# Altium schematic sheet USB3.0_INTERFACE.SchDoc
size A4; SheetNumber: 7; SheetTotal: 20
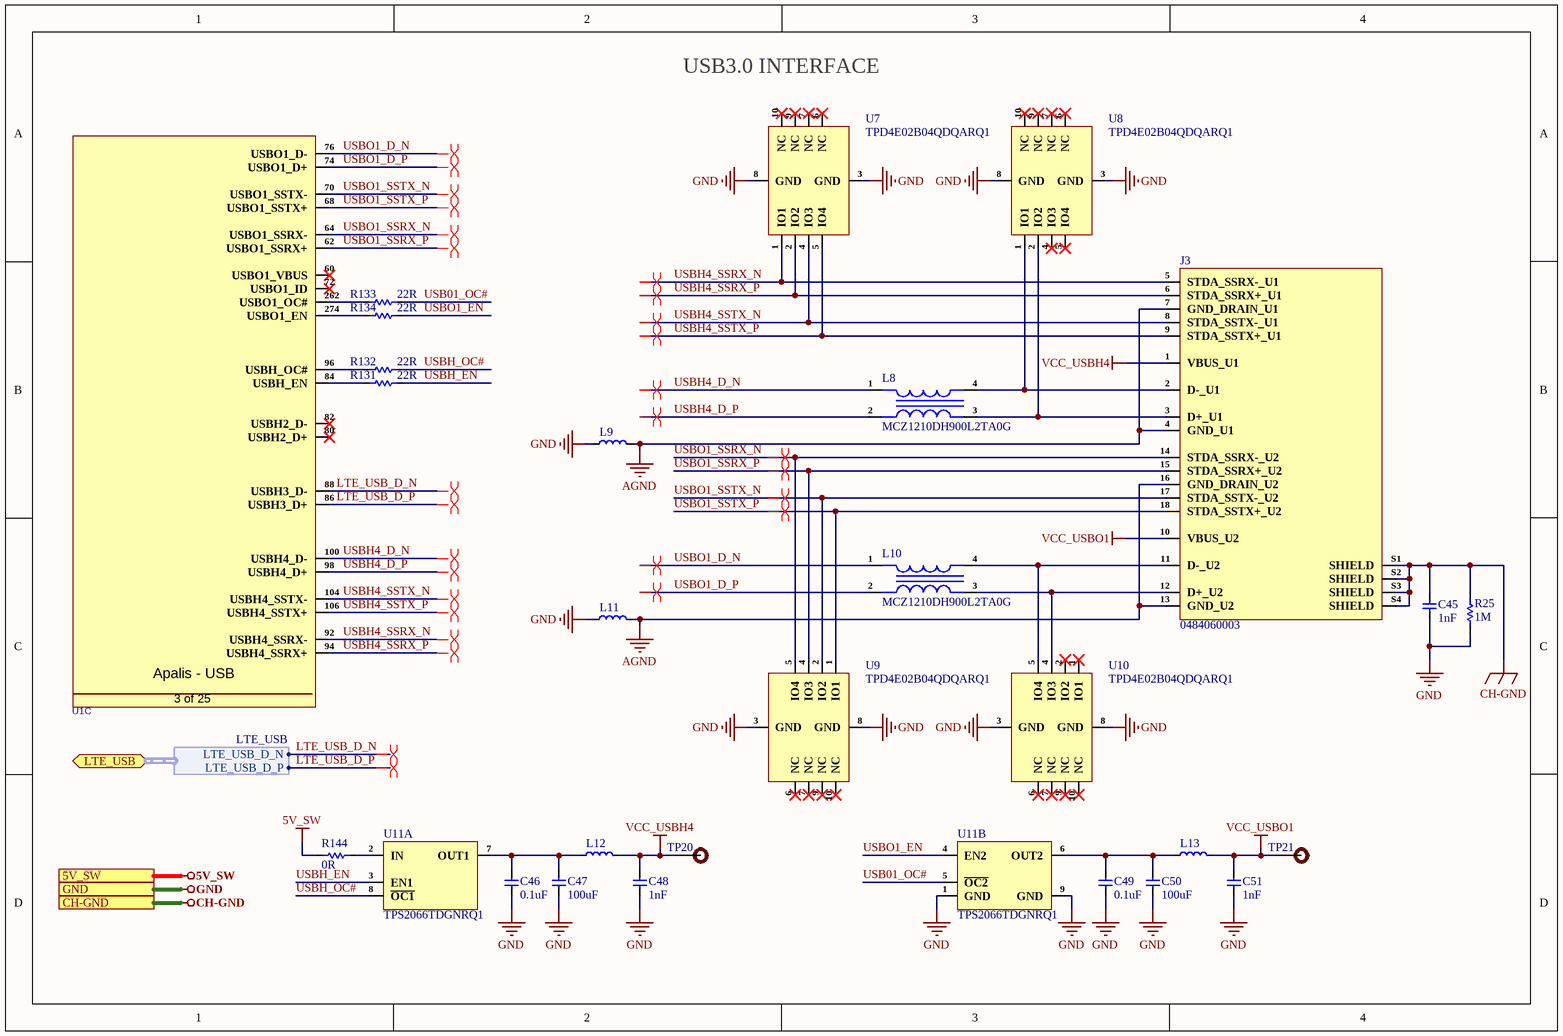
[diagram p0: USB3.0_INTERFACE.SchDoc]

## Parts
C45  1nF  [Cap-1206]
C46  0.1uF  [Cap-0402]
C47  100uF  [Cap-1210]
C48  1nF  [Cap-0402]
C49  0.1uF  [Cap-0402]
C50  100uF  [Cap-1210]
C51  1nF  [Cap-0402]
J3  0484060003  [0484060003]
L8  MCZ1210DH900L2TA0G  [MCZ1210DH900L2TA0G]
L9  BLM18EG221TN1D  [IND-0603 (1608 Metric)]  (value not drawn)
L10  MCZ1210DH900L2TA0G  [MCZ1210DH900L2TA0G]
L11  BLM18EG221TN1D  [IND-0603 (1608 Metric)]  (value not drawn)
L12  BLM18EG221TN1D  [IND-0603 (1608 Metric)]  (value not drawn)
L13  BLM18EG221TN1D  [IND-0603 (1608 Metric)]  (value not drawn)
R25  1M  [Res-0402]
R131  22R  [Res-0402]
R132  22R  [Res-0402]
R133  22R  [Res-0402]
R134  22R  [Res-0402]
R144  0R  [Res-1206]
TP20  DNP  [Test-point]  (value not drawn)
TP21  DNP  [Test-point]  (value not drawn)
U1  MM70-314B1-2-R300  [MM70-314B1-2-R300]  (value not drawn)  (part C of 25)
U7  TPD4E02B04QDQARQ1  [10-USON (2.5x1)]
U8  TPD4E02B04QDQARQ1  [10-USON (2.5x1)]
U9  TPD4E02B04QDQARQ1  [10-USON (2.5x1)]
U10  TPD4E02B04QDQARQ1  [10-USON (2.5x1)]
U11  TPS2066TDGNRQ1  [8-HVSSOP]  (parts A,B of 2)

## Ports
5V_SW (see Top_Sheet[1C], APALIS_POWER_SUPPLY[1D], CODEC_INTERFACE[1D], FUTURE_USE_CONNECTOR[1D], HDMI_INTERFACE[1D], LTE_MODULE[1D]), CH-GND (see Top_Sheet[1C], ETHERNET_INTERFACE[1D], HDMI_INTERFACE[1D], LTE_MODULE[1D], MECHANICAL_FOR_PCB[1D]), GND (see Top_Sheet[1C], 03-CAN2_SPI_CAN_CONTROLLER[1D], APALIS_POWER_SUPPLY[1D], CAN2_SPI_CAN_CONTROLLER[1D], CODEC_INTERFACE[1D], CONNECTORS[1D], DC_DC_CONVERTER[1D], DIGITAL_I-O_O-P[1D], ETHERNET_INTERFACE[1D], FUTURE_USE_CONNECTOR[1D], GPIO_NC_INTERFACE[4B], HDMI_INTERFACE[1D], I2C_INTERFACE[1B], INPUT_SUPPLY_PROTECTION[1D], LTE_MODULE[1D], MECHANICAL_FOR_PCB[1D], MICRO_SD_CARD_INTERFACE[1D], Reset_and_SDIO[1D], UART_INTERFACE[1D]), LTE_USB (bidir, harness LTE_USB, see Top_Sheet[1C], LTE_MODULE[2D])

## Harnesses
LTE_USB: LTE_USB_D_N, LTE_USB_D_P

## Nets
5V_SW: R144.1 ; port 5V_SW
AGND: J3.4(GND_U1) J3.7(GND_DRAIN_U1) J3.13(GND_U2) J3.16(GND_DRAIN_U2) L9.2 L11.2
CH-GND: C45.2 J3.S1(SHIELD) J3.S2(SHIELD) J3.S3(SHIELD) J3.S4(SHIELD) R25.2 ; port CH-GND
GND: C45.1 C46.1 C47.1 C48.1 C49.1 C50.1 C51.1 L9.1 L11.1 R25.1 U7.3(GND) U7.8(GND) U8.3(GND) U8.8(GND) U9.3(GND) U9.8(GND) U10.3(GND) U10.8(GND) U11.1(GND) U11.9(GND) ; port GND
VCC_USBH4: C48.2 J3.1(VBUS_U1) L12.2 TP20.1
VCC_USBO1: C51.2 J3.10(VBUS_U2) L13.2 TP21.1
LTE_USB_D_N: U1.88(USBH3_D-) ; port LTE_USB.LTE_USB_D_N
LTE_USB_D_P: U1.86(USBH3_D+) ; port LTE_USB.LTE_USB_D_P
USB01_OC#: R133.2 U11.5(~{OC2})
USBH4_D_N: L8.1 U1.100(USBH4_D-)
USBH4_D_P: L8.2 U1.98(USBH4_D+)
USBH4_SSRX_N: J3.5(STDA_SSRX-_U1) U1.92(USBH4_SSRX-) U7.1(IO1)
USBH4_SSRX_P: J3.6(STDA_SSRX+_U1) U1.94(USBH4_SSRX+) U7.2(IO2)
USBH4_SSTX_N: J3.8(STDA_SSTX-_U1) U1.104(USBH4_SSTX-) U7.4(IO3)
USBH4_SSTX_P: J3.9(STDA_SSTX+_U1) U1.106(USBH4_SSTX+) U7.5(IO4)
USBH_EN: R131.2 U11.3(EN1)
USBH_OC#: R132.2 U11.8(~{OC1})
USBO1_D_N: L10.1 U1.76(USBO1_D-)
USBO1_D_P: L10.2 U1.74(USBO1_D+)
USBO1_EN: R134.2 U11.4(EN2)
USBO1_SSRX_N: J3.14(STDA_SSRX-_U2) U1.64(USBO1_SSRX-) U9.5(IO4)
USBO1_SSRX_P: J3.15(STDA_SSRX+_U2) U1.62(USBO1_SSRX+) U9.4(IO3)
USBO1_SSTX_N: J3.17(STDA_SSTX-_U2) U1.70(USBO1_SSTX-) U9.2(IO2)
USBO1_SSTX_P: J3.18(STDA_SSTX+_U2) U1.68(USBO1_SSTX+) U9.1(IO1)
NetC46_2: C46.2 C47.2 L12.1 U11.7(OUT1)
NetC49_2: C49.2 C50.2 L13.1 U11.6(OUT2)
NetJ3_2: J3.2(D-_U1) L8.4 U8.1(IO1)
NetJ3_3: J3.3(D+_U1) L8.3 U8.2(IO2)
NetJ3_11: J3.11(D-_U2) L10.4 U10.5(IO4)
NetJ3_12: J3.12(D+_U2) L10.3 U10.4(IO3)
NetR131_1: R131.1 U1.84(USBH_EN)
NetR132_1: R132.1 U1.96(USBH_OC#)
NetR133_1: R133.1 U1.262(USBO1_OC#)
NetR134_1: R134.1 U1.274(USBO1_EN)
NetR144_2: R144.2 U11.2(IN)

Not connected (* = marked no-connect by the designer): U1 60(USBO1_VBUS)* 72(USBO1_ID)* 80(USBH2_D+)* 82(USBH2_D-)*; U7 6(NC)* 7(NC)* 9(NC)* 10(NC)*; U8 4(IO3)* 5(IO4)* 6(NC)* 7(NC)* 9(NC)* 10(NC)*; U9 6(NC)* 7(NC)* 9(NC)* 10(NC)*; U10 1(IO1)* 2(IO2)* 6(NC)* 7(NC)* 9(NC)* 10(NC)*

## Layout directives
differential pair; differential pair class LTE USB; rule Matched Net Lengths [Tolerance = 0.508mm]; rule Impedance Constraint [Min = 115.0    Max = 125.0    ]: LTE_USB_D_N, LTE_USB_D_P, USBH4_D_N, USBH4_D_P, USBH4_SSRX_N, USBH4_SSRX_P, USBH4_SSTX_N, USBH4_SSTX_P, USBO1_D_N, USBO1_D_P, USBO1_SSRX_N, USBO1_SSRX_P, USBO1_SSTX_N, USBO1_SSTX_P

## Notes on the sheet
- (near U7) USB3.0 INTERFACE
- (in symbol MM70-314B1-2-R300, part C) Apalis - USB; 3 of 25

## Library data of the parts
C45 = C1206C102KGRACAUTO: CAP CER 1000PF 2KV X7R 1206; Manufacturer: KEMET; Dielectric Material: Ceramic; Tolerance: 10%; Supplier: Mouser; Supplier Part Number: 80-C1206C102KGRAUTO; Manufacturer Part Number: C1206C102KGRACAUTO; RoHS: No; Category: Ceramic Capacitors; Stock: 90441; Pricing: 1=0.26, 10=0.119, 50=0.119, 100=0.072, 1000=0.063, 10000=0.052 (USD); Mounting Technology: Surface Mount; Case/Package: 1206; Case Code (Metric): 3216; Case Code (Imperial): 1206; Contact Plating: Tin,Matte; Min Operating Temperature: -55°C; Max Operating Temperature: 125°C; Voltage Rating: 2kV; Packaging: Cut Tape; Value: 1nF; Dielectric: X7R; Termination: SMD/SMT; Voltage Rating (DC): 2kV; Series: SMD Auto X7R HV; Construction: Flat; Length: 3.2mm; Ratings: AEC-Q200; Reach SVHC Compliant: No; RoHS Compliant: No; ComponentLink1URL: http://www.farnell.com/datasheets/2741171.pdf?src-supplier=Farnell; ComponentLink1Description: http://www.farnell.com/datasheets/2741171.pdf?src-supplier=Farnell; ComponentLink2URL: http://www.mouser.com/ds/2/212/KEM_C1010_X7R_HV_SMD-1102742.pdf?src-supplier=Mouser; ComponentLink2Description: http://www.mouser.com/ds/2/212/KEM_C1010_X7R_HV_SMD-1102742.pdf?src-supplier=Mouser; ComponentLink3URL: http://capacitoredge.kemet.com/capedge2/DataSheet/Datasheet-C1206C102KGRACAUTO.pdf?pn=C1206C102KGRACAUTO&src-supplier=Avnet; ComponentLink3Description: http://capacitoredge.kemet.com/capedge2/DataSheet/Datasheet-C1206C102KGRACAUTO.pdf?pn=C1206C102KGRACAUTO&src-supplier=Avnet; ComponentLink4URL: http://www.farnell.com/datasheets/2741171.pdf?src-supplier=Newark; ComponentLink4Description: http://www.farnell.com/datasheets/2741171.pdf?src-supplier=Newark; ComponentLink5URL: https://datasheet.octopart.com/C1206C102KGRACAUTO-Kemet-datasheet-41767101.pdf?src-supplier=Newark; ComponentLink5Description: https://datasheet.octopart.com/C1206C102KGRACAUTO-Kemet-datasheet-41767101.pdf?src-supplier=Newark; ComponentLink6URL: https://api.kemet.com/component-edge/download/datasheet/C1206C102KGRACAUTO.pdf?src-supplier=Digi-Key; ComponentLink6Description: https://api.kemet.com/component-edge/download/datasheet/C1206C102KGRACAUTO.pdf?src-supplier=Digi-Key; ComponentLink7URL: https://datasheet.octopart.com/C1206C102KGRACAUTO-KEMET-datasheet-149525142.pdf?src-supplier=Farnell; ComponentLink7Description: https://datasheet.octopart.com/C1206C102KGRACAUTO-KEMET-datasheet-149525142.pdf?src-supplier=Farnell; ComponentLink8URL: http://www.farnell.com/datasheets/2741171.pdf?src-supplier=Element14; ComponentLink8Description: http://www.farnell.com/datasheets/2741171.pdf?src-supplier=Element14; ComponentLink9URL: https://datasheet.octopart.com/C1206C102KGRACAUTO-Kemet-datasheet-66532414.pdf?src-supplier=Element14; ComponentLink9Description: https://datasheet.octopart.com/C1206C102KGRACAUTO-Kemet-datasheet-66532414.pdf?src-supplier=Element14; ComponentLink10URL: https://datasheet.octopart.com/C1206C102KGRACAUTO-KEMET-datasheet-140424778.pdf?src-supplier=TME; ComponentLink10Description: https://datasheet.octopart.com/C1206C102KGRACAUTO-KEMET-datasheet-140424778.pdf?src-supplier=TME; ComponentLink11URL: https://datasheet.octopart.com/C1206C102KGRACAUTO-KEMET-datasheet-147336163.pdf?src-supplier=LKR; ComponentLink11Description: https://datasheet.octopart.com/C1206C102KGRACAUTO-KEMET-datasheet-147336163.pdf?src-supplier=LKR
C46 C49 = C0402C104K4REC7867: Cap Cer 0402 0.1UF 16V X7R 10%; Manufacturer: KEMET; Item Type: Capacitor; Supplier: Digi-Key; Supplier Part Number: 399-C0402C104K4REC7867CT-ND; Manufacturer Part Number: C0402C104K4REC7867; RoHS: No; Category: Ceramic Capacitors; Stock: 10918; Pricing: 1=0.1, 10=0.072, 50=0.0408, 100=0.0338, 500=0.02372, 1000=0.01963, 2500=0.01827, 5000=0.01672 (USD)
C47 C50 = C3225X7T1A107M250AC: CAP CER 100UF 10V X7T 1210; Manufacturer: TDK; Supplier: Digi-Key; Supplier Part Number: 445-C3225X7T1A107M250ACCT-ND; Manufacturer Part Number: C3225X7T1A107M250AC; RoHS: Yes; Category: Ceramic Capacitors; Stock: 654; Pricing: 1=1.75, 10=1.385, 50=1.2004, 100=1.0388, 500=0.78484 (USD)
C48 C51 = C0402S102K5RAC7867: CAP CER 1000PF 50V X7R 0402; Manufacturer: KEMET; Item Type: Capacitor; Supplier: Mouser; Supplier Part Number: 80-C0402S102K5R7867; Manufacturer Part Number: C0402S102K5RAC7867; RoHS: Yes; Stock: 17394; Pricing: 1=0.43, 10=0.208, 50=0.208, 100=0.156, 1000=0.113, 10000=0.092 (USD); RoHS Compliant: Yes; ComponentLink1URL: https://api.kemet.com/component-edge/download/datasheet/C0402S102K5RAC7867.pdf?src-supplier=Digi-Key; ComponentLink1Description: https://api.kemet.com/component-edge/download/datasheet/C0402S102K5RAC7867.pdf?src-supplier=Digi-Key
J3 = 0484060003: CONN RCPT USB3.0 TYPEA STACK R/A; Manufacturer: Molex; Supplier: Mouser; Supplier Part Number: 538-48406-0003; Manufacturer Part Number: 0484060003; RoHS: Yes; Stock: 6983; Pricing: 1=2.63, 10=2.32, 50=2.32, 100=1.84, 1000=1.79, 10000=1.36 (USD); ComponentLink1URL: https://datasheet.octopart.com/48406-0003-Molex-datasheet-101583044.pdf?src-supplier=Farnell; ComponentLink1Description: https://datasheet.octopart.com/48406-0003-Molex-datasheet-101583044.pdf?src-supplier=Farnell; ComponentLink2URL: https://www.molex.com/pdm_docs/sd/484060003_sd.pdf?src-supplier=Digi-Key; ComponentLink2Description: https://www.molex.com/pdm_docs/sd/484060003_sd.pdf?src-supplier=Digi-Key; ComponentLink3URL: https://datasheet.octopart.com/48406-0003-Molex-datasheet-33003502.pdf?src-supplier=Newark; ComponentLink3Description: https://datasheet.octopart.com/48406-0003-Molex-datasheet-33003502.pdf?src-supplier=Newark; ComponentLink4URL: https://datasheet.octopart.com/48406-0003-Molex-datasheet-21137617.pdf?src-supplier=Sager+Electronics; ComponentLink4Description: https://datasheet.octopart.com/48406-0003-Molex-datasheet-21137617.pdf?src-supplier=Sager+Electronics; ComponentLink5URL: https://datasheet.octopart.com/484060003-Molex-datasheet-168216735.pdf?src-supplier=TME; ComponentLink5Description: https://datasheet.octopart.com/484060003-Molex-datasheet-168216735.pdf?src-supplier=TME; ComponentLink6URL: https://datasheet.octopart.com/48406-0003-Molex-datasheet-154752298.pdf?src-supplier=Master+Electronics; ComponentLink6Description: https://datasheet.octopart.com/48406-0003-Molex-datasheet-154752298.pdf?src-supplier=Master+Electronics
L8 L10 = MCZ1210DH900L2TA0G: CMC 100MA 2LN 90 OHM SMD; Manufacturer: TDK; Supplier: Mouser; Supplier Part Number: 810-MCZ1210DH900L2TG; Manufacturer Part Number: MCZ1210DH900L2TA0G; RoHS: Yes; Category: Common Mode Chokes; Stock: 11260; Pricing: 1=0.58, 10=0.372, 50=0.372, 100=0.297, 1000=0.231, 10000=0.231 (USD); ComponentLink1URL: https://media.digikey.com/pdf/Data%20Sheets/TDK%20PDFs/MCZ_Series_Br.pdf?src-supplier=Digi-Key; ComponentLink1Description: https://media.digikey.com/pdf/Data%20Sheets/TDK%20PDFs/MCZ_Series_Br.pdf?src-supplier=Digi-Key; ComponentLink2URL: https://product.tdk.com/info/en/catalog/datasheets/cmf_commercial_signal_mcz1210dh_en.pdf?src-supplier=Digi-Key; ComponentLink2Description: https://product.tdk.com/info/en/catalog/datasheets/cmf_commercial_signal_mcz1210dh_en.pdf?src-supplier=Digi-Key
L9 L11-L13 = BLM18EG221TN1D: FERRITE BEAD 220 OHM 0603 1LN; Manufacturer: Murata; Supplier: Avnet; Supplier Part Number: BLM18EG221TN1D; Manufacturer Part Number: BLM18EG221TN1D; RoHS: Yes; Category: Ferrite Beads and Chips; Stock: 4000; Pricing: 4000=0.07735, 8000=0.07553, 16000=0.07371, 24000=0.07189, 32000=0.07007 (USD); ComponentLink1URL: https://datasheet.ciiva.com/11795/0900766b811b5866-11795384.pdf?src-supplier=Rs; ComponentLink1Description: https://datasheet.ciiva.com/11795/0900766b811b5866-11795384.pdf?src-supplier=Rs; ComponentLink2URL: https://datasheet.ciiva.com/41449/001172266-da-01-en-drossel-0603-220r-1-6x0-8mm-4000st-41449580.pdf?src-supplier=Conrad; ComponentLink2Description: https://datasheet.ciiva.com/41449/001172266-da-01-en-drossel-0603-220r-1-6x0-8mm-4000st-41449580.pdf?src-supplier=Conrad; ComponentLink3URL: https://datasheet.ciiva.com/1467/5169-1467159.pdf?src-supplier=Element14; ComponentLink3Description: https://datasheet.ciiva.com/1467/5169-1467159.pdf?src-supplier=Element14; ComponentLink4URL: https://datasheet.ciiva.com/1467/5169-1467160.pdf?src-supplier=Element14; ComponentLink4Description: https://datasheet.ciiva.com/1467/5169-1467160.pdf?src-supplier=Element14; ComponentLink5URL: https://datasheet.ciiva.com/8510/l0110s0101blm18e-8510167.pdf?src-supplier=Avnet; ComponentLink5Description: https://datasheet.ciiva.com/8510/l0110s0101blm18e-8510167.pdf?src-supplier=Avnet; ComponentLink6URL: https://datasheet.ciiva.com/16419/l0110s0101blm18e-16419150.pdf?src-supplier=Future+Electronics; ComponentLink6Description: https://datasheet.ciiva.com/16419/l0110s0101blm18e-16419150.pdf?src-supplier=Future+Electronics; ComponentLink7URL: https://datasheet.ciiva.com/6211/l0110s0101blm18e-6211853.pdf?src-supplier=Digi-Key; ComponentLink7Description: https://datasheet.ciiva.com/6211/l0110s0101blm18e-6211853.pdf?src-supplier=Digi-Key
R25 = CRGCQ0402J1M0: RES 1M OHM 5% 1/16W 0402; Manufacturer: TE Connectivity; Value: 1MR; Max Power Dissipation: 63mW; Temperature Coefficient: 100ppm/°C; Power Rating: 62.5mW; Voltage Rating: 50V; Supplier: Arrow Electronics; Supplier Part Number: CRGCQ0402J1M0; Manufacturer Part Number: CRGCQ0402J1M0; RoHS: Yes; Category: Chip SMD Resistors; Stock: 50000; Pricing: 20000=0.0015 (USD); Case/Package: 0402; Case Code (Imperial): 0402; Case Code (Metric): 1005; Min Operating Temperature: -55°C; Max Operating Temperature: 155°C; Features: Moisture Resistant,Automotive AEC-Q200; Packaging: Cut Tape; Tolerance: 5%; Number of Terminations: 2; Series: CRGCQ; Voltage Rating (DC): 50V; Height: 400um; Ratings: AEC-Q200; RoHS Compliant: Yes; ComponentLink1URL: http://datasheet.octopart.com/CRGCQ0402J1M0-TE-Connectivity-datasheet-114679081.pdf?src-supplier=Mouser; ComponentLink1Description: http://datasheet.octopart.com/CRGCQ0402J1M0-TE-Connectivity-datasheet-114679081.pdf?src-supplier=Mouser; ComponentLink2URL: http://datasheet.octopart.com/CRGCQ0402J1M0-TE-Connectivity-datasheet-114679081.pdf?src-supplier=Arrow+Electronics; ComponentLink2Description: http://datasheet.octopart.com/CRGCQ0402J1M0-TE-Connectivity-datasheet-114679081.pdf?src-supplier=Arrow+Electronics; ComponentLink3URL: http://datasheet.octopart.com/CRGCQ0402J1M0-TE-Connectivity-datasheet-114679081.pdf?src-supplier=Onlinecomponents.com; ComponentLink3Description: http://datasheet.octopart.com/CRGCQ0402J1M0-TE-Connectivity-datasheet-114679081.pdf?src-supplier=Onlinecomponents.com; ComponentLink4URL: http://datasheet.octopart.com/CRGCQ0402J1M0-TE-Connectivity-datasheet-114679081.pdf?src-supplier=Digi-Key; ComponentLink4Description: http://datasheet.octopart.com/CRGCQ0402J1M0-TE-Connectivity-datasheet-114679081.pdf?src-supplier=Digi-Key; ComponentLink5URL: http://datasheet.octopart.com/CRGCQ0402J1M0-TE-Connectivity-datasheet-114679081.pdf?src-supplier=Verical; ComponentLink5Description: http://datasheet.octopart.com/CRGCQ0402J1M0-TE-Connectivity-datasheet-114679081.pdf?src-supplier=Verical; ComponentLink6URL: https://www.te.com/commerce/DocumentDelivery/DDEController?Action=srchrtrv&DocNm=1773204-3&DocType=DS&DocLang=English&src-supplier=Digi-Key; ComponentLink6Description: https://www.te.com/commerce/DocumentDelivery/DDEController?Action=srchrtrv&DocNm=1773204-3&DocType=DS&DocLang=English&src-supplier=Digi-Key; ComponentLink7URL: http://datasheet.octopart.com/CRGCQ0402J1M0-TE-Connectivity-datasheet-114679081.pdf?src-supplier=Newark; ComponentLink7Description: http://datasheet.octopart.com/CRGCQ0402J1M0-TE-Connectivity-datasheet-114679081.pdf?src-supplier=Newark; ComponentLink8URL: http://datasheet.octopart.com/CRGCQ0402J1M0-TE-Connectivity-datasheet-114679081.pdf?src-supplier=Avnet; ComponentLink8Description: http://datasheet.octopart.com/CRGCQ0402J1M0-TE-Connectivity-datasheet-114679081.pdf?src-supplier=Avnet; ComponentLink9URL: http://datasheet.octopart.com/CRGCQ0402J1M0-TE-Connectivity-datasheet-114679081.pdf?src-supplier=Farnell; ComponentLink9Description: http://datasheet.octopart.com/CRGCQ0402J1M0-TE-Connectivity-datasheet-114679081.pdf?src-supplier=Farnell; ComponentLink10URL: http://datasheet.octopart.com/CRGCQ0402J1M0-TE-Connectivity-datasheet-114679081.pdf?src-supplier=Sager+Electronics; ComponentLink10Description: http://datasheet.octopart.com/CRGCQ0402J1M0-TE-Connectivity-datasheet-114679081.pdf?src-supplier=Sager+Electronics; ComponentLink11URL: http://datasheet.octopart.com/CRGCQ0402J1M0-TE-Connectivity-datasheet-114679081.pdf?src-supplier=TME; ComponentLink11Description: http://datasheet.octopart.com/CRGCQ0402J1M0-TE-Connectivity-datasheet-114679081.pdf?src-supplier=TME; ComponentLink12URL: http://datasheet.octopart.com/CRGCQ0402J1M0-TE-Connectivity-datasheet-114679081.pdf?src-supplier=Electro+Sonic; ComponentLink12Description: http://datasheet.octopart.com/CRGCQ0402J1M0-TE-Connectivity-datasheet-114679081.pdf?src-supplier=Electro+Sonic; ComponentLink13URL: http://datasheet.octopart.com/CRGCQ0402J1M0-TE-Connectivity-datasheet-114679081.pdf?src-supplier=Interstate+Connecting+Components; ComponentLink13Description: http://datasheet.octopart.com/CRGCQ0402J1M0-TE-Connectivity-datasheet-114679081.pdf?src-supplier=Interstate+Connecting+Components; ComponentLink14URL: http://datasheet.octopart.com/CRGCQ0402J1M0-TE-Connectivity-datasheet-114679081.pdf?src-supplier=Heilind+Electronics; ComponentLink14Description: http://datasheet.octopart.com/CRGCQ0402J1M0-TE-Connectivity-datasheet-114679081.pdf?src-supplier=Heilind+Electronics; ComponentLink15URL: https://datasheet.octopart.com/CRGCQ0402J1M0-TE-Connectivity-datasheet-114679081.pdf?src-supplier=Master+Electronics; ComponentLink15Description: https://datasheet.octopart.com/CRGCQ0402J1M0-TE-Connectivity-datasheet-114679081.pdf?src-supplier=Master+Electronics
R131-R134 = CRGCQ0402J22R: RES 22 OHM 5% 1/16W 0402; Manufacturer: TE Connectivity; Supplier: Avnet; Supplier Part Number: 73AC8982; Manufacturer Part Number: CRGCQ0402J22R; RoHS: Yes; Category: Chip SMD Resistors; Stock: 20000; Pricing: 1=0.036, 25=0.01, 100=0.008, 250=0.006, 500=0.005 (USD); ComponentLink1URL: https://www.te.com/commerce/DocumentDelivery/DDEController?Action=srchrtrv&amp;DocNm=1773204-3&amp;DocType=DS&amp;DocLang=English&src-supplier=Digi-Key; ComponentLink1Description: https://www.te.com/commerce/DocumentDelivery/DDEController?Action=srchrtrv&amp;DocNm=1773204-3&amp;DocType=DS&amp;DocLang=English&src-supplier=Digi-Key; ComponentLink2URL: https://4donline.ihs.com/images/VipMasterIC/IC/TYEL/TYEL-S-A0004929575/TYEL-S-A0004929575-1.pdf?hkey=52A5661711E402568146F3353EA87419&src-supplier=Newark; ComponentLink2Description: https://4donline.ihs.com/images/VipMasterIC/IC/TYEL/TYEL-S-A0004929575/TYEL-S-A0004929575-1.pdf?hkey=52A5661711E402568146F3353EA87419&src-supplier=Newark; ComponentLink3URL: https://4donline.ihs.com/images/VipMasterIC/IC/TYEL/TYEL-S-A0004929575/TYEL-S-A0004929575-1.pdf?hkey=52A5661711E402568146F3353EA87419&src-supplier=Element14; ComponentLink3Description: https://4donline.ihs.com/images/VipMasterIC/IC/TYEL/TYEL-S-A0004929575/TYEL-S-A0004929575-1.pdf?hkey=52A5661711E402568146F3353EA87419&src-supplier=Element14; ComponentLink4URL: https://datasheet.octopart.com/CRGCQ0402J22R-TE-Connectivity-datasheet-114679081.pdf?src-supplier=Master+Electronics; ComponentLink4Description: https://datasheet.octopart.com/CRGCQ0402J22R-TE-Connectivity-datasheet-114679081.pdf?src-supplier=Master+Electronics
R144 = RC1206JR-070RL: RES 0 OHM JUMPER 1/4W 1206; Manufacturer: Yageo; Value: 0mR; Tolerance: 5%; Power Rating: 250mW; Voltage Rating: 200V; Temperature Coefficient: 200ppm/°C; Supplier: Future Electronics; Supplier Part Number: 1070203; Manufacturer Part Number: RC1206JR-070RL; RoHS: Yes; Category: Chip SMD Resistors; Stock: 615000; Pricing: 5000=0.0047, 25000=0.0045, 100000=0.0042, 250000=0.0041, 625000=0.0038 (USD); Case/Package: 1206; Contact Plating: Tin,Matte; Case Code (Metric): 3216; Case Code (Imperial): 1206; Min Operating Temperature: -55°C; Max Operating Temperature: 155°C; Resistor Type: Thick Film,Carbon Film; Packaging: Tape and Reel; Package Quantity: 1; Number of Terminations: 2; Termination: SMD/SMT; Max Power Dissipation: 250mW; Series: RC; Resistance Tolerance: 5%; Technology: THICK FILM; Features: Moisture Resistant; Voltage Rating (AC): 200V; Length: 0.122inch; Width: 0.063inch; Height: 0.026inch; Depth: 1.6mm; Lead Free: Lead Free; RoHS Compliant: Yes; Reach SVHC Compliant: Unknown; ComponentLink1URL: https://datasheet.ciiva.com/11808/0900766b80c6630a-11808156.pdf?src-supplier=Rs; ComponentLink1Description: https://datasheet.ciiva.com/11808/0900766b80c6630a-11808156.pdf?src-supplier=Rs; ComponentLink2URL: https://datasheet.ciiva.com/29181/402222-da-01-en-smd-widerstand-0-ohm-1206-29181568.pdf?src-supplier=Conrad; ComponentLink2Description: https://datasheet.ciiva.com/29181/402222-da-01-en-smd-widerstand-0-ohm-1206-29181568.pdf?src-supplier=Conrad; ComponentLink3URL: https://datasheet.ciiva.com/7983/444357-7983807.pdf?src-supplier=Element14; ComponentLink3Description: https://datasheet.ciiva.com/7983/444357-7983807.pdf?src-supplier=Element14; ComponentLink4URL: https://datasheet.ciiva.com/22747/1692832-22747541.pdf?src-supplier=Element14; ComponentLink4Description: https://datasheet.ciiva.com/22747/1692832-22747541.pdf?src-supplier=Element14; ComponentLink5URL: https://datasheet.ciiva.com/46445/444357-46445719.pdf?src-supplier=Element14; ComponentLink5Description: https://datasheet.ciiva.com/46445/444357-46445719.pdf?src-supplier=Element14; ComponentLink6URL: https://datasheet.ciiva.com/2458/pyu-rc1206-51-rohs-l-4-2458669.pdf?src-supplier=Digi-Key; ComponentLink6Description: https://datasheet.ciiva.com/2458/pyu-rc1206-51-rohs-l-4-2458669.pdf?src-supplier=Digi-Key; ComponentLink7URL: https://datasheet.ciiva.com/2458/pyu-rc1206-51-rohs-l-4-2458670.pdf?src-supplier=Digi-Key; ComponentLink7Description: https://datasheet.ciiva.com/2458/pyu-rc1206-51-rohs-l-4-2458670.pdf?src-supplier=Digi-Key; ComponentLink8URL: https://datasheet.ciiva.com/2458/pyu-rc1206-51-rohs-l-4-2458668.pdf?src-supplier=Digi-Key; ComponentLink8Description: https://datasheet.ciiva.com/2458/pyu-rc1206-51-rohs-l-4-2458668.pdf?src-supplier=Digi-Key; ComponentLink9URL: https://datasheet.ciiva.com/7857/1692832-7857422.pdf?src-supplier=Element14; ComponentLink9Description: https://datasheet.ciiva.com/7857/1692832-7857422.pdf?src-supplier=Element14; ComponentLink10URL: https://datasheet.ciiva.com/7857/1692832-7857421.pdf?src-supplier=Element14; ComponentLink10Description: https://datasheet.ciiva.com/7857/1692832-7857421.pdf?src-supplier=Element14; ComponentLink11URL: https://datasheet.ciiva.com/17035/pyu-rc1206-51-rohs-l-4-17035512.pdf?src-supplier=Future+Electronics; ComponentLink11Description: https://datasheet.ciiva.com/17035/pyu-rc1206-51-rohs-l-4-17035512.pdf?src-supplier=Future+Electronics
TP20 TP21 = TEST POINT: Test Point ON; Item Type: TEST POINT
U1 = MM70-314B1-2-R300: CONN MXM 3.0 FMALE 314POS 0.020; Manufacturer: JAE Electronics; Supplier: Digi-Key; Supplier Part Number: 670-MM70-314B1-2-R300CT-ND; Manufacturer Part Number: MM70-314B1-2-R300; RoHS: No; Category: Card Edge Connectors; Stock: 4979; Pricing: 1=9.21, 10=8.287, 25=7.8064, 50=7.6064, 100=7.4062 (USD)
U7-U10 = TPD4E02B04QDQARQ1: TVS DIODE 3.6VWM 8.8VC 10USON; Manufacturer: Texas Instruments; Interface: LVDS,USB,Ethernet,HDMI; Number of Channels: 4; Reverse Standoff Voltage: 3.6V; Min Breakdown Voltage: 5.5V; Peak Pulse Current: 2A; Peak Pulse Power: 17W; Power Line Protection: No; Diode Type: ZENER; Supplier: Mouser; Supplier Part Number: 595-D4E02B04QDQARQ1; Manufacturer Part Number: TPD4E02B04QDQARQ1; RoHS: Yes; Category: Integrated Circuits (ICs); Stock: 35915; Pricing: 1=0.63, 10=0.544, 50=0.544, 100=0.383, 1000=0.27, 10000=0.227 (USD); Mounting Technology: Surface Mount; Pins: 10; Min Operating Temperature: -40°C; Max Operating Temperature: 125°C; Packaging: Cut Tape; Number of Bidirectional Channels: 4; Series: Automotive, AEC-Q101; RoHS Compliant: Yes; ComponentLink1URL: http://www.ti.com/lit/ds/symlink/tpd4e02b04-q1.pdf?src-supplier=Digi-Key; ComponentLink1Description: http://www.ti.com/lit/ds/symlink/tpd4e02b04-q1.pdf?src-supplier=Digi-Key
U11 = TPS2066TDGNRQ1: IC PWR SWITCH N-CHAN 1:2 8MSOP; Manufacturer: Texas Instruments; Supplier: Mouser; Supplier Part Number: 595-TPS2066TDGNRQ1; Manufacturer Part Number: TPS2066TDGNRQ1; RoHS: Yes; Category: Hot Swap Controllers; Stock: 11970; Pricing: 1=1.82, 10=1.66, 50=1.66, 100=1.33, 1000=0.963, 10000=0.825 (USD); ComponentLink1URL: https://datasheet.ciiva.com/4924/slvsb37-121164-4924528.pdf?src-supplier=Mouser; ComponentLink1Description: https://datasheet.ciiva.com/4924/slvsb37-121164-4924528.pdf?src-supplier=Mouser; ComponentLink2URL: https://datasheet.ciiva.com/1963/slvsb37-1963712.pdf?src-supplier=Digi-Key; ComponentLink2Description: https://datasheet.ciiva.com/1963/slvsb37-1963712.pdf?src-supplier=Digi-Key; ComponentLink3URL: https://datasheet.ciiva.com/14207/tps2066-q1-14207125.pdf?src-supplier=Avnet; ComponentLink3Description: https://datasheet.ciiva.com/14207/tps2066-q1-14207125.pdf?src-supplier=Avnet